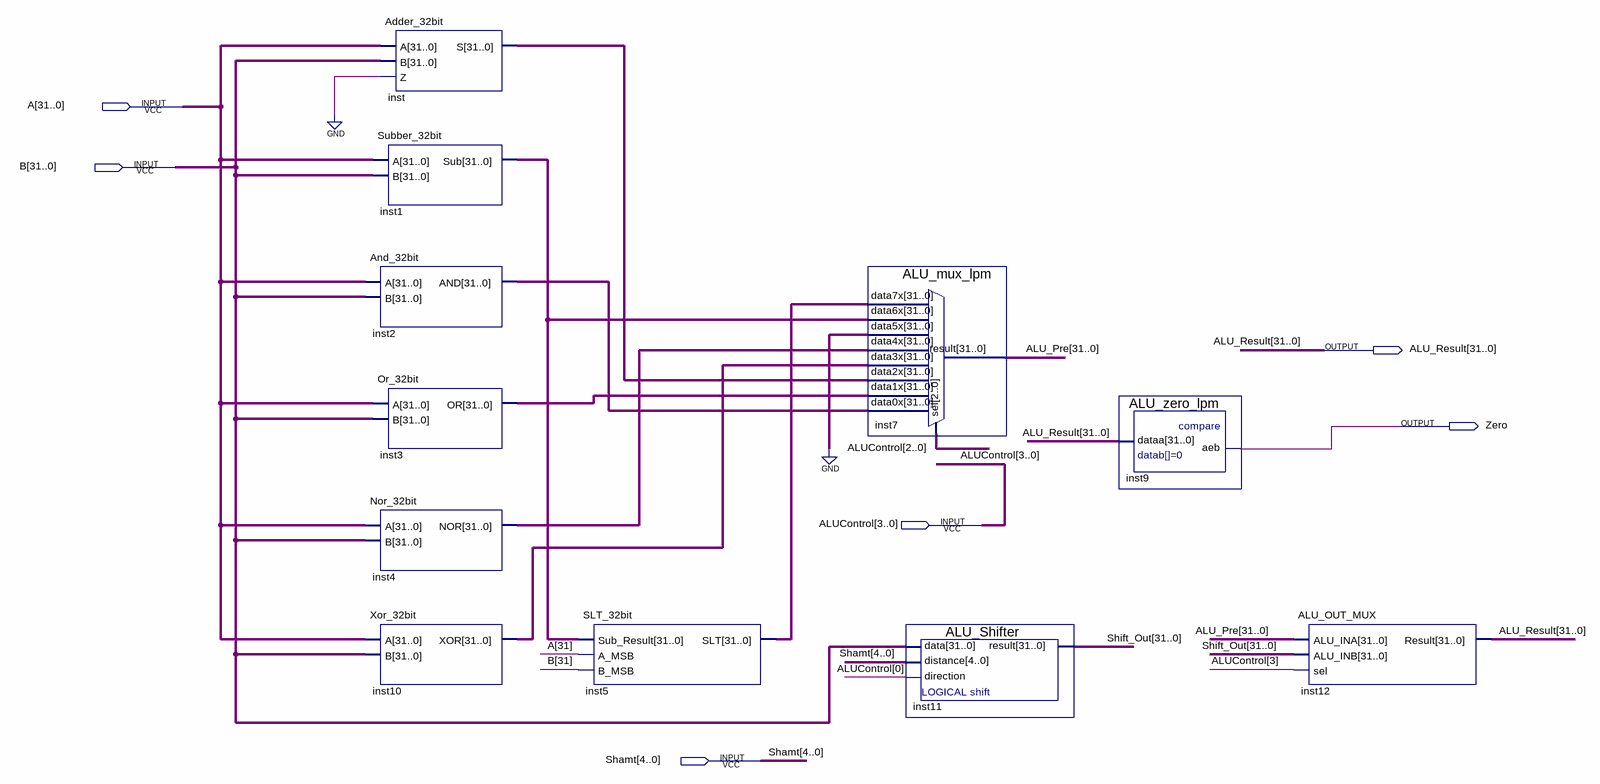
[diagram p0: schematic sheet]
// Quartus schematic ALU.bdf as structural Verilog: 11 symbols, 6 pins
module ALU (
  input  [31:0] A,
  input  [31:0] B,
  input  [3:0] ALUControl,
  input  [4:0] Shamt,
  output [31:0] ALU_Result,
  output Zero
);

  wire [31:0] ALU_Pre, inst1_sub, inst2_and, inst3_or, inst4_nor, inst5_slt, inst10_xor, inst_s, Shift_Out;

  Adder_32bit inst (.A(A), .B(B), .Z(1'b0), .S(inst_s));
  Subber_32bit inst1 (.A(A), .B(B), .Sub(inst1_sub));
  And_32bit inst2 (.A(A), .B(B), .AND(inst2_and));
  Or_32bit inst3 (.A(A), .B(B), .OR(inst3_or));
  Nor_32bit inst4 (.A(A), .B(B), .NOR(inst4_nor));
  Xor_32bit inst10 (.A(A), .B(B), .XOR(inst10_xor));
  SLT_32bit inst5 (.Sub_Result(inst1_sub), .A_MSB(A[31]), .B_MSB(B[31]), .SLT(inst5_slt));
  ALU_mux_lpm inst7 (
    .data7x(inst5_slt), .data6x(inst1_sub), .data5x({32{1'b0}}), .data4x(inst4_nor), .data3x(inst10_xor),
    .data2x(inst_s), .data1x(inst3_or), .data0x(inst2_and), .sel(ALUControl[2:0]), .result(ALU_Pre));
  ALU_Shifter inst11 (.data(B), .distance(Shamt), .direction(ALUControl[0]), .result(Shift_Out));
  ALU_zero_lpm inst9 (.dataa(ALU_Result), .aeb(Zero));
  ALU_OUT_MUX inst12 (.ALU_INA(ALU_Pre), .ALU_INB(Shift_Out), .sel(ALUControl[3]), .Result(ALU_Result));
endmodule
